# Altium project Sampler.PrjPCB (part 1 of 5)
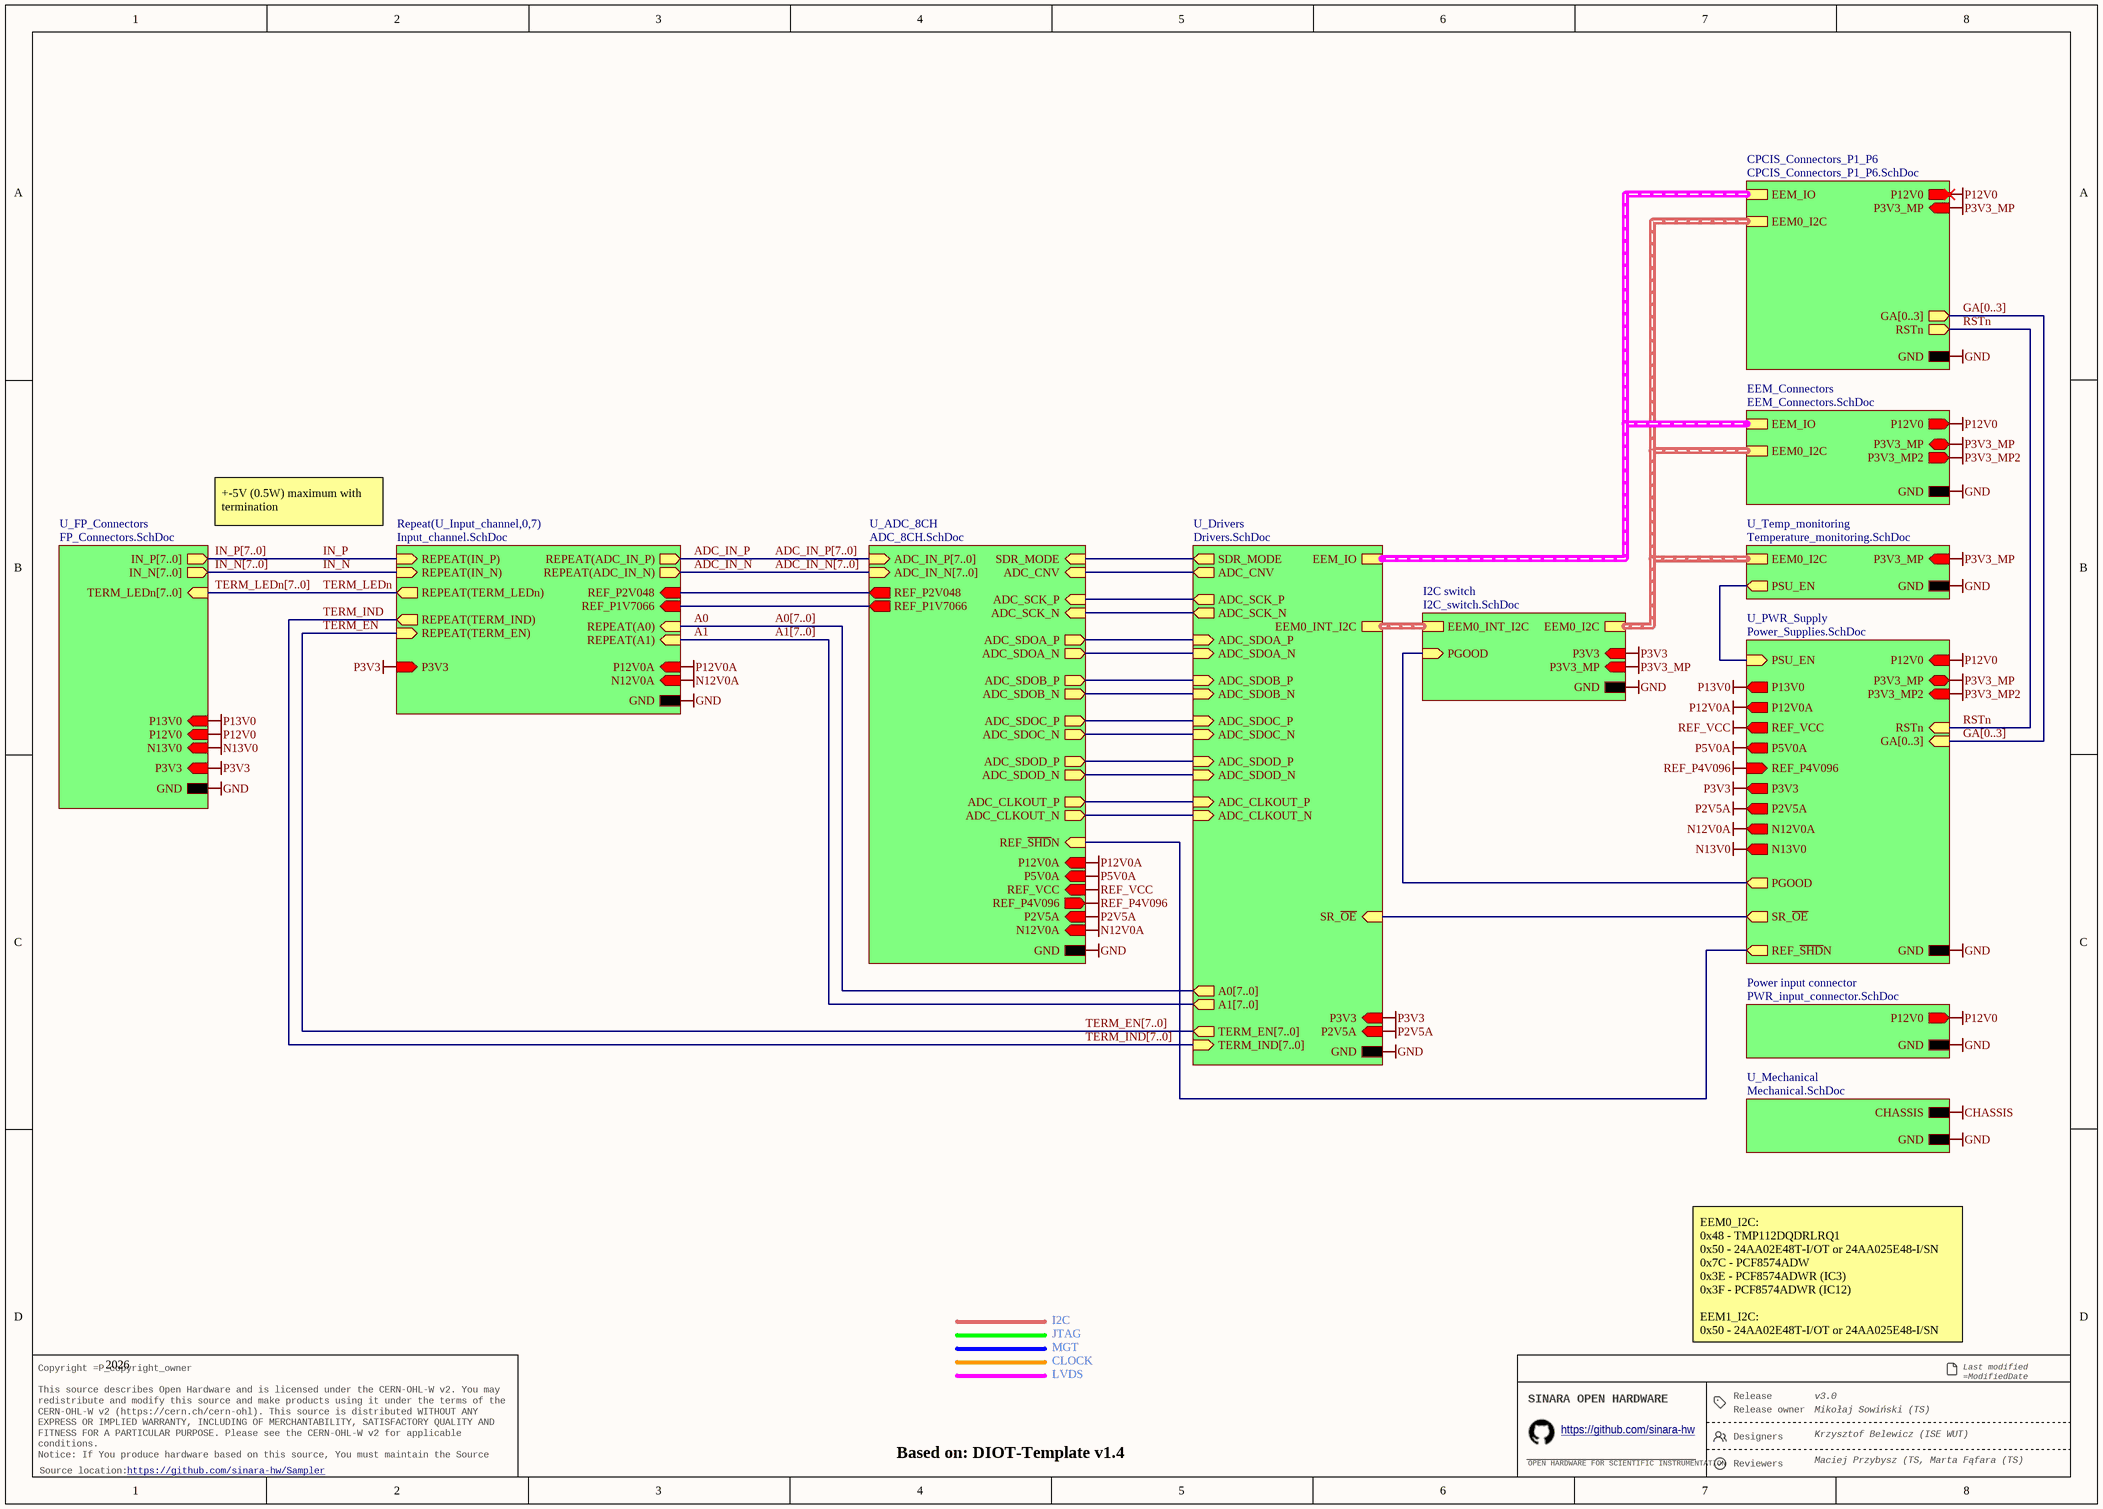
[diagram p0: Sampler.SchDoc]
P_version: 3.0; P_template_version: 1.4; P_release_reviewers: Maciej Przybysz (TS, Marta Fąfara (TS); P_release_owner: Mikołaj Sowiński (TS); P_release_designers: Krzysztof Belewicz (ISE WUT); P_github_link: https://github.com/sinara-hw/Sampler; P_copyright_owner: WUT ISE 2024-2025 · Technosystem 2025-2026
16 sheets, 774 parts. Net scope: strictly hierarchical (ports join the sheet entries above them; power ports are local).
Board file: Sampler.PCBDOC
Sheets:
  Sampler.SchDoc
    U_PWR_Supply = Power_Supplies.SchDoc
      U_Power-up_delay = Power-up_delay.SchDoc
      U_Power_main_DCDC = Power_main_DCDC.SchDoc
      LEDs = LEDs.SchDoc
    CPCIS_Connectors_P1_P6 = CPCIS_Connectors_P1_P6.SchDoc
      U_DIOT_signal_routing = DIOT_signal_routing.SchDoc
    EEM_Connectors = EEM_Connectors.SchDoc
    U_Temp_monitoring = Temperature_monitoring.SchDoc
    U_Mechanical = Mechanical.SchDoc
    U_FP_Connectors = FP_Connectors.SchDoc
    U_ADC_8CH = ADC_8CH.SchDoc
    U_Input_channel0 = Input_channel.SchDoc
    U_Input_channel1 = Input_channel.SchDoc
    U_Input_channel2 = Input_channel.SchDoc
    U_Input_channel3 = Input_channel.SchDoc
    U_Input_channel4 = Input_channel.SchDoc
    U_Input_channel5 = Input_channel.SchDoc
    U_Input_channel6 = Input_channel.SchDoc
    U_Input_channel7 = Input_channel.SchDoc
    U_Drivers = Drivers.SchDoc
    I2C switch = I2C_switch.SchDoc
    Power input connector = PWR_input_connector.SchDoc

## Sheet Sampler.SchDoc: =DocumentName
size A3; Version: 3.0; Github: https://github.com/sinara-hw/Sampler; Last modified by: Krzysztof Belewicz; DocumentNumber: 1; Revision: 0; SheetNumber: 1; SheetTotal: 1

### Sub-sheets
CPCIS_Connectors_P1_P6 = CPCIS_Connectors_P1_P6.SchDoc: P12V0 (out), P3V3_MP (in), EEM_IO (harness EEM_LVDS), EEM0_I2C (harness I2C), GA[0..3] (out), GND, RSTn (out)
EEM_Connectors = EEM_Connectors.SchDoc: P3V3_MP (bidir), P12V0 (out), EEM_IO (harness EEM_LVDS), EEM0_I2C (harness I2C), GND, P3V3_MP2 (out)
I2C switch = I2C_switch.SchDoc: PGOOD (in), EEM0_I2C (harness I2C), EEM0_INT_I2C (harness I2C), GND, P3V3 (in), P3V3_MP (in)
Power input connector = PWR_input_connector.SchDoc: P12V0 (out), GND
Repeat(U_Input_channel,0,7) = Input_channel.SchDoc: REPEAT(IN_N) (in), REPEAT(A0) (in), REPEAT(A1) (in), REPEAT(IN_P) (in), REPEAT(TERM_IND) (out), REPEAT(ADC_IN_N) (out), REPEAT(ADC_IN_P) (out), REF_P2V048 (in), REF_P1V7066 (in), GND, N12V0A (in), P12V0A (in), REPEAT(TERM_EN) (in), REPEAT(TERM_LEDn) (out), P3V3 (in)
U_ADC_8CH = ADC_8CH.SchDoc: ADC_IN_P[7..0] (in), ADC_IN_N[7..0] (in), ADC_SDOA_P (out), ADC_SDOA_N (out), ADC_SCK_P (in), ADC_SCK_N (in), ADC_CNV (in), ADC_SDOB_N (out), ADC_SDOB_P (out), ADC_SDOC_P (out), ADC_SDOC_N (out), ADC_SDOD_N (out), ADC_SDOD_P (out), ADC_CLKOUT_P (out), ADC_CLKOUT_N (out), SDR_MODE (in), REF_P2V048 (out), REF_P1V7066 (out), REF_~{SHD}N (in), GND, P2V5A (in), P5V0A (in), REF_VCC (in), P12V0A (in), N12V0A (in), REF_P4V096 (out)
U_Drivers = Drivers.SchDoc: EEM0_INT_I2C (harness I2C), EEM_IO (harness EEM_LVDS), SR_~{OE} (in), ADC_SCK_P (out), ADC_SDOA_N (in), ADC_CLKOUT_N (in), ADC_SCK_N (out), ADC_SDOA_P (in), ADC_SDOB_P (in), ADC_SDOD_N (in), ADC_CNV (out), ADC_SDOD_P (in), ADC_SDOC_P (in), ADC_SDOC_N (in), ADC_SDOB_N (in), ADC_CLKOUT_P (in), SDR_MODE (out), GND, P3V3 (in), P2V5A (in), A0[7..0] (out), TERM_IND[7..0] (in), A1[7..0] (out), TERM_EN[7..0] (out)
U_FP_Connectors = FP_Connectors.SchDoc: GND, P3V3 (in), IN_P[7..0] (out), IN_N[7..0] (out), TERM_LEDn[7..0] (in), N13V0 (in), P12V0 (in), P13V0 (in)
U_Mechanical = Mechanical.SchDoc: CHASSIS, GND
U_PWR_Supply = Power_Supplies.SchDoc: GND, P12V0 (in), P3V3_MP (bidir), PGOOD (out), GA[0..3] (in), RSTn (in), PSU_EN (in), P3V3_MP2 (in), SR_~{OE} (out), P13V0 (out), P12V0A (out), P5V0A (out), REF_VCC (out), REF_~{SHD}N (out), REF_P4V096 (in), P3V3 (out), P2V5A (out), N12V0A (out), N13V0 (out)
U_Temp_monitoring = Temperature_monitoring.SchDoc: GND, P3V3_MP (in), EEM0_I2C (harness I2C), PSU_EN (out)

### Nets
GND: sheet U_PWR_Supply/GND, sheet CPCIS_Connectors_P1_P6/GND, sheet EEM_Connectors/GND, sheet U_Temp_monitoring/GND, sheet U_Mechanical/GND, sheet U_FP_Connectors/GND, sheet U_ADC_8CH/GND, sheet Repeat(U_Input_channel,0,7)/GND, sheet U_Drivers/GND, sheet I2C switch/GND, sheet Power input connector/GND
N12V0A: sheet U_PWR_Supply/N12V0A, sheet U_ADC_8CH/N12V0A, sheet Repeat(U_Input_channel,0,7)/N12V0A
N13V0: sheet U_PWR_Supply/N13V0, sheet U_FP_Connectors/N13V0
P2V5A: sheet U_PWR_Supply/P2V5A, sheet U_ADC_8CH/P2V5A, sheet U_Drivers/P2V5A
P3V3: sheet U_PWR_Supply/P3V3, sheet U_FP_Connectors/P3V3, sheet Repeat(U_Input_channel,0,7)/P3V3, sheet U_Drivers/P3V3, sheet I2C switch/P3V3
P3V3_MP: sheet U_PWR_Supply/P3V3_MP, sheet CPCIS_Connectors_P1_P6/P3V3_MP, sheet EEM_Connectors/P3V3_MP, sheet U_Temp_monitoring/P3V3_MP, sheet I2C switch/P3V3_MP
P3V3_MP2: sheet U_PWR_Supply/P3V3_MP2, sheet EEM_Connectors/P3V3_MP2
P5V0A: sheet U_PWR_Supply/P5V0A, sheet U_ADC_8CH/P5V0A
P12V0: sheet U_PWR_Supply/P12V0, sheet CPCIS_Connectors_P1_P6/P12V0, sheet EEM_Connectors/P12V0, sheet U_FP_Connectors/P12V0, sheet Power input connector/P12V0
P12V0A: sheet U_PWR_Supply/P12V0A, sheet U_ADC_8CH/P12V0A, sheet Repeat(U_Input_channel,0,7)/P12V0A
P13V0: sheet U_PWR_Supply/P13V0, sheet U_FP_Connectors/P13V0
REF_P1V7066: sheet U_ADC_8CH/REF_P1V7066, sheet Repeat(U_Input_channel,0,7)/REF_P1V7066
REF_P2V048: sheet U_ADC_8CH/REF_P2V048, sheet Repeat(U_Input_channel,0,7)/REF_P2V048
REF_P4V096: sheet U_PWR_Supply/REF_P4V096, sheet U_ADC_8CH/REF_P4V096
REF_VCC: sheet U_PWR_Supply/REF_VCC, sheet U_ADC_8CH/REF_VCC
A0: sheet Repeat(U_Input_channel,0,7)/REPEAT(A0)
A1: sheet Repeat(U_Input_channel,0,7)/REPEAT(A1)
ADC_CLKOUT_N: sheet U_ADC_8CH/ADC_CLKOUT_N, sheet U_Drivers/ADC_CLKOUT_N
ADC_CLKOUT_P: sheet U_ADC_8CH/ADC_CLKOUT_P, sheet U_Drivers/ADC_CLKOUT_P
ADC_CNV: sheet U_ADC_8CH/ADC_CNV, sheet U_Drivers/ADC_CNV
ADC_IN_N: sheet Repeat(U_Input_channel,0,7)/REPEAT(ADC_IN_N)
ADC_IN_P: sheet Repeat(U_Input_channel,0,7)/REPEAT(ADC_IN_P)
ADC_SCK_N: sheet U_ADC_8CH/ADC_SCK_N, sheet U_Drivers/ADC_SCK_N
ADC_SCK_P: sheet U_ADC_8CH/ADC_SCK_P, sheet U_Drivers/ADC_SCK_P
ADC_SDOA_N: sheet U_ADC_8CH/ADC_SDOA_N, sheet U_Drivers/ADC_SDOA_N
ADC_SDOA_P: sheet U_ADC_8CH/ADC_SDOA_P, sheet U_Drivers/ADC_SDOA_P
ADC_SDOB_N: sheet U_ADC_8CH/ADC_SDOB_N, sheet U_Drivers/ADC_SDOB_N
ADC_SDOB_P: sheet U_ADC_8CH/ADC_SDOB_P, sheet U_Drivers/ADC_SDOB_P
ADC_SDOC_N: sheet U_ADC_8CH/ADC_SDOC_N, sheet U_Drivers/ADC_SDOC_N
ADC_SDOC_P: sheet U_ADC_8CH/ADC_SDOC_P, sheet U_Drivers/ADC_SDOC_P
ADC_SDOD_N: sheet U_ADC_8CH/ADC_SDOD_N, sheet U_Drivers/ADC_SDOD_N
ADC_SDOD_P: sheet U_ADC_8CH/ADC_SDOD_P, sheet U_Drivers/ADC_SDOD_P
IN_N: sheet Repeat(U_Input_channel,0,7)/REPEAT(IN_N)
IN_P: sheet Repeat(U_Input_channel,0,7)/REPEAT(IN_P)
PGOOD: sheet U_PWR_Supply/PGOOD, sheet I2C switch/PGOOD
PSU_EN: sheet U_PWR_Supply/PSU_EN, sheet U_Temp_monitoring/PSU_EN
REF_~{SHD}N: sheet U_PWR_Supply/REF_~{SHD}N, sheet U_ADC_8CH/REF_~{SHD}N
RSTn: sheet U_PWR_Supply/RSTn, sheet CPCIS_Connectors_P1_P6/RSTn
SDR_MODE: sheet U_ADC_8CH/SDR_MODE, sheet U_Drivers/SDR_MODE
SR_~{OE}: sheet U_PWR_Supply/SR_~{OE}, sheet U_Drivers/SR_~{OE}
TERM_EN: sheet Repeat(U_Input_channel,0,7)/REPEAT(TERM_EN)
TERM_IND: sheet Repeat(U_Input_channel,0,7)/REPEAT(TERM_IND)
TERM_LEDn: sheet Repeat(U_Input_channel,0,7)/REPEAT(TERM_LEDn)

### Buses and harness runs
bus A0[7..0] = sheet U_Drivers/A0[7..0]
bus A1[7..0] = sheet U_Drivers/A1[7..0]
bus ADC_IN_N[7..0] = sheet U_ADC_8CH/ADC_IN_N[7..0]
bus ADC_IN_P[7..0] = sheet U_ADC_8CH/ADC_IN_P[7..0]
bus GA[0..3] = sheet CPCIS_Connectors_P1_P6/GA[0..3] = sheet U_PWR_Supply/GA[0..3]
bus IN_N[7..0] = sheet U_FP_Connectors/IN_N[7..0]
bus IN_P[7..0] = sheet U_FP_Connectors/IN_P[7..0]
bus TERM_EN[7..0] = sheet U_Drivers/TERM_EN[7..0]
bus TERM_IND[7..0] = sheet U_Drivers/TERM_IND[7..0]
bus TERM_LEDn[7..0] = sheet U_FP_Connectors/TERM_LEDn[7..0]
harness sheet CPCIS_Connectors_P1_P6/EEM0_I2C = sheet EEM_Connectors/EEM0_I2C = sheet I2C switch/EEM0_I2C = sheet U_Temp_monitoring/EEM0_I2C
harness sheet CPCIS_Connectors_P1_P6/EEM_IO = sheet EEM_Connectors/EEM_IO = sheet U_Drivers/EEM_IO
harness sheet I2C switch/EEM0_INT_I2C = sheet U_Drivers/EEM0_INT_I2C

### Notes on the sheet
- +-5V (0.5W) maximum with termination
- I2C
- 2026
- JTAG
- MGT
- CLOCK
- LVDS
- EEM0_I2C:
  0x48 - TMP112DQDRLRQ1
  0x50 - 24AA02E48T-I/OT or 24AA025E48-I/SN
  0x7C - PCF8574ADW
  0x3E - PCF8574ADWR (IC3)
  0x3F - PCF8574ADWR (IC12)
  EEM1_I2C:
  0x50 - 24AA02E48T-I/OT or 24AA025E48-I/SN
- Release
- Last modified =ModifiedDate
  Sheet =sheetnumber of =sheettotal · Size A3
- Copyright =P_copyright_owner
  This source describes Open Hardware and is licensed under the CERN-OHL-W v2. You may redistribute and modify this source and make products using it under the terms of the CERN-OHL-W v2 (https://cern.ch/cern-ohl). This source is distributed WITHOUT ANY EXPRESS OR IMPLIED WARRANTY, INCLUDING OF MERCHANTABILITY, SATISFACTORY QUALITY AND FITNESS FOR A PARTICULAR PURPOSE. Please see the CERN-OHL-W v2 for applicable conditions.
  Notice: If You produce hardware based on this source, You must maintain the Source Location visible on the product, its packaging or its documentation.
- SINARA OPEN HARDWARE
- OPEN HARDWARE FOR SCIENTIFIC INSTRUMENTATION
- https://github.com/sinara-hw
- Release owner
- Designers
- Reviewers
- Source location:

## Sheet Power_Supplies.SchDoc: =DocumentName
size A4; SPICEModelCache: <root> / <DocumentId>GVTSYOHF</DocumentId> / </root>; Version: 3.0; Github: https://github.com/sinara-hw/Sampler; Last modified by: Krzysztof Belewicz; DocumentNumber: 1; Revision: 0; SheetNumber: 3; SheetTotal: 16
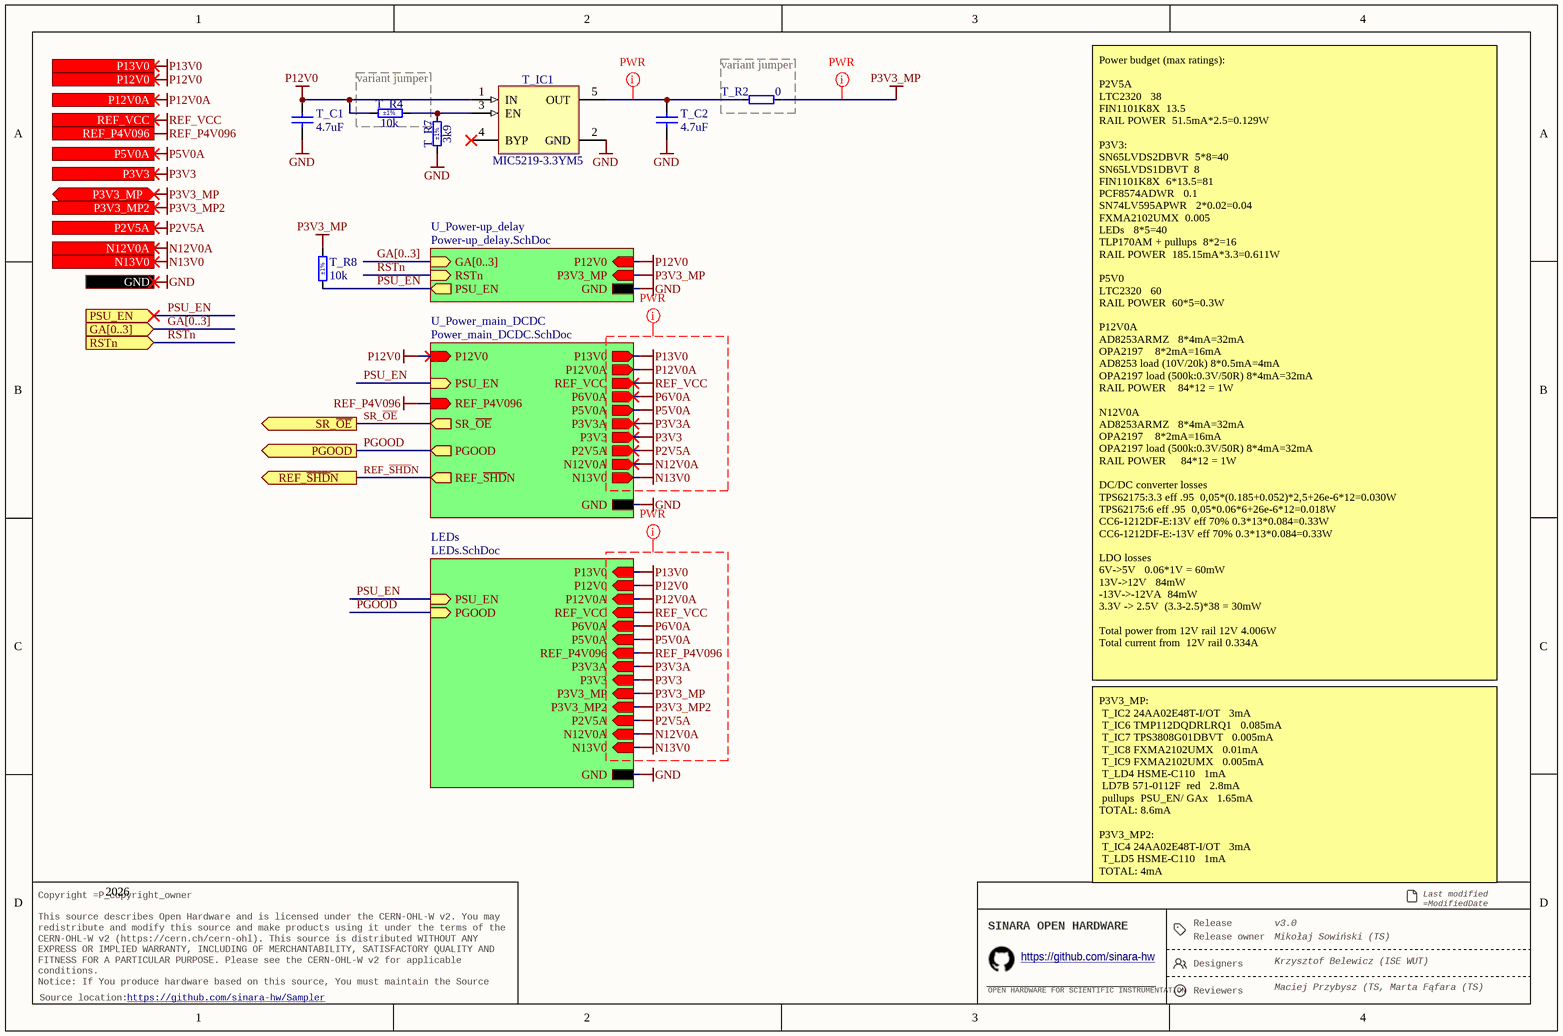
[diagram p1: Power_Supplies.SchDoc]

### Parts
T_C1  4.7uF  [CAPC2012X135N]
T_C2  4.7uF  [CAPC2012X135N]
T_IC1  MIC5219-3.3YM5  [SOT95P280X145-5N]
T_R2  0  [RESC1005X40N]
T_R4  10k  Tolerance: ±1%  [RESC1005X40N]
T_R7  3k9  Tolerance: ±1%  [RESC1005X40N]
T_R8  10k  Tolerance: ±1%  [RESC1005X40N]

### Blocks framed on the sheet
variant jumper: T_R4
variant jumper: T_R2

### Sub-sheets
LEDs = LEDs.SchDoc: PSU_EN (in), PGOOD (in), GND, P13V0 (in), P5V0A (in), P12V0A (in), P6V0A (in), REF_VCC (in), P3V3 (in), N13V0 (in), P2V5A (in), N12V0A (in), P3V3A (in), P12V0 (in), REF_P4V096 (in), P3V3_MP (in), P3V3_MP2 (in)
U_Power-up_delay = Power-up_delay.SchDoc: GA[0..3] (in), RSTn (in), GND, PSU_EN (out), P3V3_MP (in), P12V0 (in)
U_Power_main_DCDC = Power_main_DCDC.SchDoc: P12V0 (in), PSU_EN (in), P13V0 (out), P5V0A (out), P12V0A (out), SR_~{OE} (out), P6V0A (out), REF_VCC (out), PGOOD (out), REF_~{SHD}N (out), GND, P3V3 (out), N13V0 (out), P2V5A (out), N12V0A (out), P3V3A (out), REF_P4V096 (in)

### Ports
GA[0..3] (in), GND, N12V0A (out), N13V0 (out), P2V5A (out), P3V3 (out), P3V3_MP2 (in), P3V3_MP (bidir), P5V0A (out), P12V0 (in), P12V0A (out), P13V0 (out), PGOOD (out), PSU_EN (in), REF_P4V096 (in), REF_VCC (out), REF_~{SHD}N (out), RSTn (in), SR_~{OE} (out)

### Nets
GND: T_C1.1 T_C2.1 T_IC1.2(GND) T_R7.1 ; port GND, sheet U_Power-up_delay/GND, sheet U_Power_main_DCDC/GND, sheet LEDs/GND
N12V0A: port N12V0A, sheet U_Power_main_DCDC/N12V0A, sheet LEDs/N12V0A
N13V0: port N13V0, sheet U_Power_main_DCDC/N13V0, sheet LEDs/N13V0
P2V5A: port P2V5A, sheet U_Power_main_DCDC/P2V5A, sheet LEDs/P2V5A
P3V3: port P3V3, sheet U_Power_main_DCDC/P3V3, sheet LEDs/P3V3
P3V3_MP: T_R2.2 T_R8.2 ; port P3V3_MP, sheet U_Power-up_delay/P3V3_MP, sheet LEDs/P3V3_MP
P3V3_MP2: port P3V3_MP2, sheet LEDs/P3V3_MP2
P3V3A: sheet U_Power_main_DCDC/P3V3A, sheet LEDs/P3V3A
P5V0A: port P5V0A, sheet U_Power_main_DCDC/P5V0A, sheet LEDs/P5V0A
P6V0A: sheet U_Power_main_DCDC/P6V0A, sheet LEDs/P6V0A
P12V0: T_C1.2 T_IC1.1(IN) T_R4.1 ; port P12V0, sheet U_Power-up_delay/P12V0, sheet U_Power_main_DCDC/P12V0, sheet LEDs/P12V0
P12V0A: port P12V0A, sheet U_Power_main_DCDC/P12V0A, sheet LEDs/P12V0A
P13V0: port P13V0, sheet U_Power_main_DCDC/P13V0, sheet LEDs/P13V0
REF_P4V096: port REF_P4V096, sheet U_Power_main_DCDC/REF_P4V096, sheet LEDs/REF_P4V096
REF_VCC: port REF_VCC, sheet U_Power_main_DCDC/REF_VCC, sheet LEDs/REF_VCC
PGOOD: port PGOOD, sheet U_Power_main_DCDC/PGOOD, sheet LEDs/PGOOD
PSU_EN: T_R8.1 ; port PSU_EN, sheet U_Power-up_delay/PSU_EN, sheet U_Power_main_DCDC/PSU_EN, sheet LEDs/PSU_EN
REF_~{SHD}N: port REF_~{SHD}N, sheet U_Power_main_DCDC/REF_~{SHD}N
RSTn: port RSTn, sheet U_Power-up_delay/RSTn
SR_~{OE}: port SR_~{OE}, sheet U_Power_main_DCDC/SR_~{OE}
NetT_C2_2: T_C2.2 T_IC1.5(OUT) T_R2.1
NetT_IC1_3: T_IC1.3(EN) T_R4.2 T_R7.2

Not connected (* = marked no-connect by the designer): T_IC1 4(BYP)*

### Buses and harness runs
bus GA[0..3] = port GA[0..3]
bus GA[0..3] = sheet U_Power-up_delay/GA[0..3]

### Layout directives
net class PWR: N12V0A, N13V0, NetT_C2_2, P2V5A, P3V3, P3V3_MP, P3V3_MP2, P3V3A, P5V0A, P6V0A, P12V0, P12V0A, P13V0, REF_P4V096, REF_VCC

### Notes on the sheet
- Power budget (max ratings):
  P2V5A
  LTC2320			38
  FIN1101K8X		13.5
  RAIL POWER		51.5mA*2.5=0.129W
  P3V3:
  SN65LVDS2DBVR		5*8=40
  SN65LVDS1DBVT		8
  FIN1101K8X		6*13.5=81
  PCF8574ADWR 		0.1
  SN74LV595APWR 		2*0.02=0.04
  FXMA2102UMX		0.005
  LEDs			8*5=40
  TLP170AM + pullups		8*2=16
  RAIL POWER		185.15mA*3.3=0.611W
  P5V0
  LTC2320			60
  RAIL POWER		60*5=0.3W
  P12V0A
  AD8253ARMZ 		8*4mA=32mA
  OPA2197 			8*2mA=16mA
  AD8253 load (10V/20k)	8*0.5mA=4mA
  OPA2197 load (500k:0.3V/50R)	8*4mA=32mA
  RAIL POWER 		 84*12 = 1W
  N12V0A
  AD8253ARMZ 		8*4mA=32mA
  OPA2197 			8*2mA=16mA
  OPA2197 load (500k:0.3V/50R)	8*4mA=32mA
  RAIL POWER  		 84*12 = 1W
  DC/DC converter losses
  TPS62175:3.3 eff .95		0,05*(0.185+0.052)*2,5+26e-6*12=0.030W
  TPS62175:6 eff .95		0,05*0.06*6+26e-6*12=0.018W
  CC6-1212DF-E:13V eff 70%	0.3*13*0.084=0.33W
  CC6-1212DF-E:-13V eff 70%	0.3*13*0.084=0.33W
  LDO losses
  6V->5V			0.06*1V = 60mW
  13V->12V			84mW
  -13V->-12VA		84mW
  3.3V -> 2.5V		(3.3-2.5)*38 = 30mW
  Total power from 12V rail	12V 4.006W
  Total current from  12V rail	0.334A
- 2026
- P3V3_MP:
  T_IC2	24AA02E48T-I/OT			3mA
  T_IC6	TMP112DQDRLRQ1			0.085mA
  T_IC7	TPS3808G01DBVT			0.005mA
  T_IC8	FXMA2102UMX			0.01mA
  T_IC9	FXMA2102UMX			0.005mA
  T_LD4	HSME-C110			1mA
  LD7B	571-0112F	 red			2.8mA
  pullups 	PSU_EN/ GAx			1.65mA
  TOTAL: 8.6mA
  P3V3_MP2:
  T_IC4	24AA02E48T-I/OT			3mA
  T_LD5	HSME-C110			1mA
  TOTAL: 4mA
- Release
- Last modified =ModifiedDate
  Sheet =sheetnumber of =sheettotal · Size A4
- Copyright =P_copyright_owner
  This source describes Open Hardware and is licensed under the CERN-OHL-W v2. You may redistribute and modify this source and make products using it under the terms of the CERN-OHL-W v2 (https://cern.ch/cern-ohl). This source is distributed WITHOUT ANY EXPRESS OR IMPLIED WARRANTY, INCLUDING OF MERCHANTABILITY, SATISFACTORY QUALITY AND FITNESS FOR A PARTICULAR PURPOSE. Please see the CERN-OHL-W v2 for applicable conditions.
  Notice: If You produce hardware based on this source, You must maintain the Source Location visible on the product, its packaging or its documentation.
- SINARA OPEN HARDWARE
- OPEN HARDWARE FOR SCIENTIFIC INSTRUMENTATION
- https://github.com/sinara-hw
- Release owner
- Designers
- Reviewers
- Source location:

### Library data of the parts
T_C1 T_C2 = CC0805_4.7UF_16V_10%_X7R: Non-polarised capacitor; Part Description: SMD Multilayer Chip Ceramic Capacitor; Manufacturer: GENERIC; Manufacturer1 Part Number: EMK212B7475KG-T; Voltage: 16V; TC: X7R; Tolerance: ±10%; Part Number: CC0805_4.7UF_16V_10%_X7R; Component Kind: Standard; Component Type: Standard; Pin Count: 2; Value: 4.7uF; Status: Preferred; Manufacturer Part Number: CC0805_4.7UF_16V_10%_X7R; Case: 0805; Mounted: Yes; Socket: No; SMD: Yes; Sense: No; Manufacturer1 Example: TAIYO YUDEN; Manufacturer1 ComponentHeight: 1.35mm; HelpURL: \\cern.ch\dfs\Applications\Altium\Datasheets\CC0805_X7R_TAIYO-YUDEN_HIGH-VALUE.pdf; Author: CERN DEM JLC; CreateDate: 16.09.2014; LatestRevisionDate: 16.09.2014
T_IC1 = MIC5219-3.3YM5: 500mA Peak Output LDO Regulator; Part Description: 3.3V 500mA Peak Output Low Drop-Out  (LDO) Regulator; Manufacturer: MICROCHIP TECHNOLOGY; PressFit: No; Bonding: No; Part Number: MIC5219-3.3YM5; Component Kind: Standard; Component Type: Standard; Device: MIC5219-3.3YM5; PackageDescription: SOT, 0.95mm pitch; 5 pin, 1.60mm W X 2.90mm L X 1.45mm H body, IPC Medium Density; Manufacturer Part Number: MIC5219-3.3YM5; Pin Count: 5; Case: SOT23-5; Mounted: Yes; Socket: No; SMD: Yes; Sense: No; ComponentHeight: 1.45mm; HelpURL: \\cern.ch\dfs\Applications\Altium\Datasheets\MIC5219-3.3YM5.pdf; Author: CERN DEM WB; CreateDate: 2019-04-16; LatestRevisionDate: 2019-04-16
T_R2 = R0402_0R_JUMPER: Resistor; Part Description: 1A (0.05R Max DC Resistance) Zero Ohm Jumper; Manufacturer: GENERIC; Manufacturer1 Part Number: 232270591001L; PressFit: No; Part Number: R0402_0R_JUMPER; Component Kind: Standard; Component Type: Standard; Pin Count: 2; Value: 0; Status: Not Recommended; Manufacturer Part Number: R0402_0R_JUMPER; Case: 0402; Mounted: Yes; Sense: No; Socket: No; SMD: Yes; Manufacturer1 Example: YAGEO PHYCOMP; Manufacturer1 ComponentHeight: 0.4mm; HelpURL: \\cern.ch\dfs\Applications\Altium\Datasheets\R0402_Phycomp_RC0402.pdf; Author: CERN DEM JLC; CreateDate: 03.12.2007; LatestRevisionDate: 17.10.2012
T_R4 T_R8 = R0402_10K_1%_0.0625W_100PPM: Resistor - 1%; Part Description: General Purpose Thick Film Chip Resistor; Manufacturer: GENERIC; Manufacturer1 Part Number: 232270671003L; TC: ±100ppm/°C; PressFit: No; Part Number: R0402_10K_1%_0.0625W_100PPM; Component Kind: Standard; Component Type: Standard; Pin Count: 2; Value: 10k; Status: Not Recommended; Power: 0.0625W; Manufacturer Part Number: R0402_10K_1%_0.0625W_100PPM; Case: 0402; Mounted: Yes; Sense: No; Socket: No; SMD: Yes; Manufacturer1 Example: YAGEO PHYCOMP; Manufacturer1 ComponentHeight: 0.4mm; HelpURL: \\cern.ch\dfs\Applications\Altium\Datasheets\R0402_Phycomp_RC0402.pdf; Author: CERN DEM JLC; CreateDate: 03.12.2007; LatestRevisionDate: 17.10.2012
T_R7 = R0402_3K9_1%_0.0625W_100PPM: Resistor - 1%; Part Description: General Purpose Thick Film Chip Resistor; Manufacturer: GENERIC; Manufacturer1 Part Number: 232270673902L; TC: ±100ppm/°C; PressFit: No; Part Number: R0402_3K9_1%_0.0625W_100PPM; Component Kind: Standard; Component Type: Standard; Pin Count: 2; Value: 3k9; Status: Not Recommended; Power: 0.0625W; Manufacturer Part Number: R0402_3K9_1%_0.0625W_100PPM; Case: 0402; Mounted: Yes; Sense: No; Socket: No; SMD: Yes; Manufacturer1 Example: YAGEO PHYCOMP; Manufacturer1 ComponentHeight: 0.4mm; HelpURL: \\cern.ch\dfs\Applications\Altium\Datasheets\R0402_Phycomp_RC0402.pdf; Author: CERN DEM JLC; CreateDate: 03.12.2007; LatestRevisionDate: 17.10.2012

## Sheet Power-up_delay.SchDoc: =DocumentName
size A4; Version: 3.0; Github: https://github.com/sinara-hw/Sampler; Last modified by: Krzysztof Belewicz; DocumentNumber: 1; Revision: 0; SheetNumber: 4; SheetTotal: 16
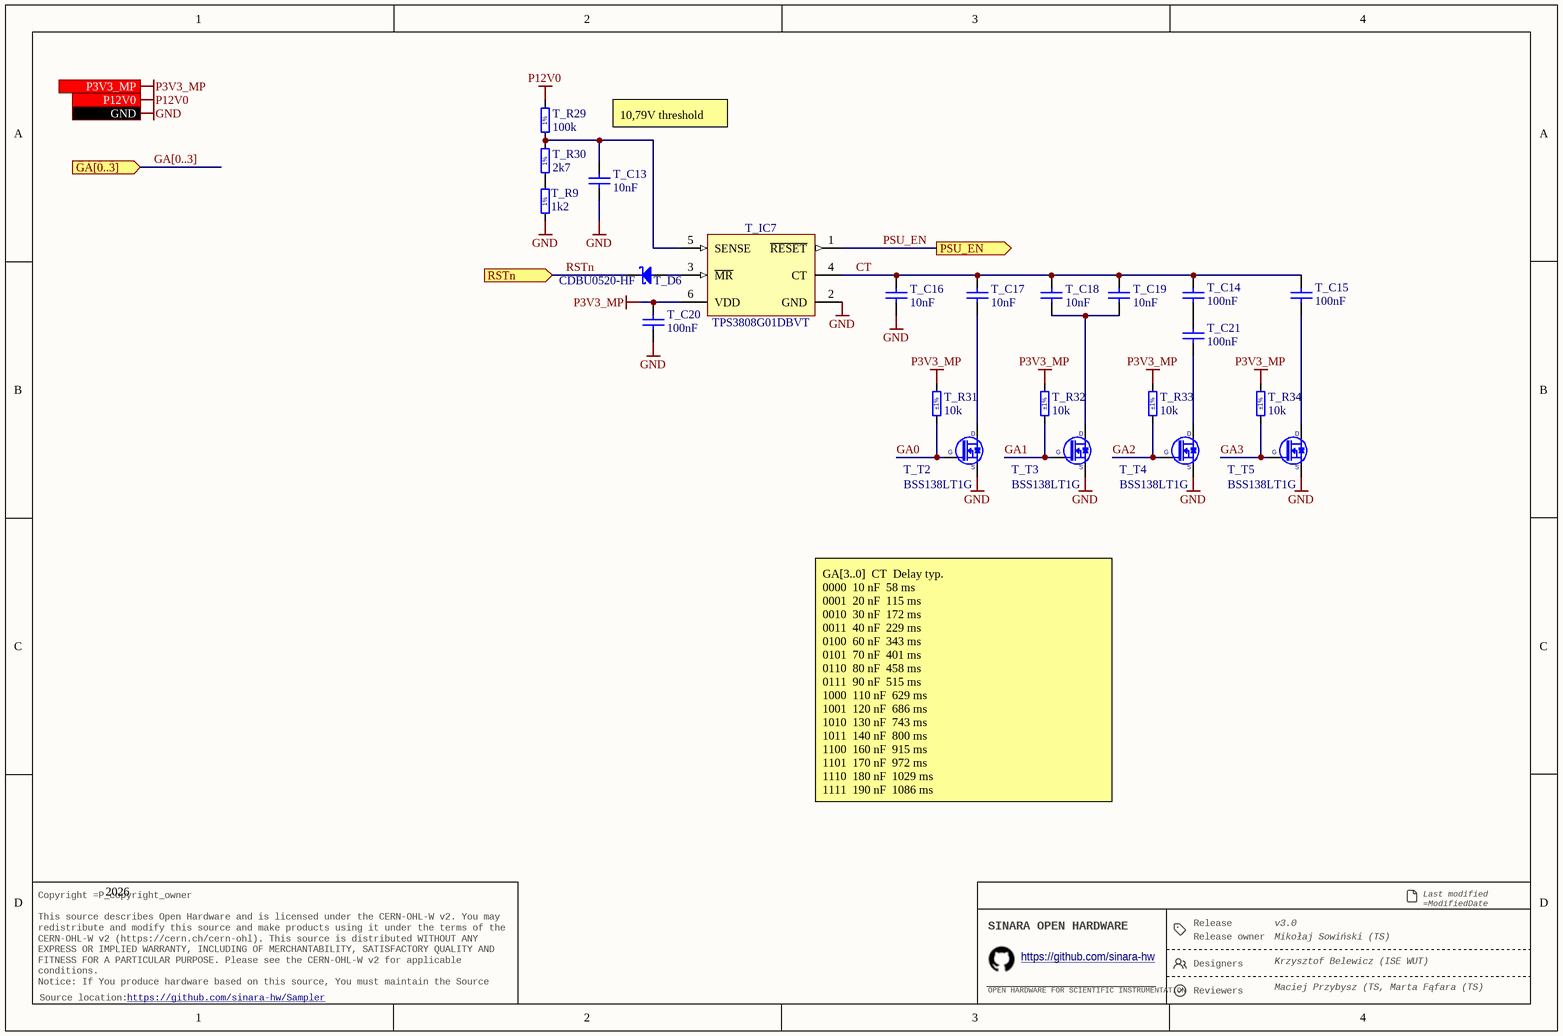
[diagram p2: Power-up_delay.SchDoc]

### Parts
T_C13  10nF  [CAPC1005X55N]
T_C14  100nF  [CAPC1005X55N]
T_C15  100nF  [CAPC1005X55N]
T_C16  10nF  [CAPC1005X55N]
T_C17  10nF  [CAPC1005X55N]
T_C18  10nF  [CAPC1005X55N]
T_C19  10nF  [CAPC1005X55N]
T_C20  100nF  [CAPC1005X55N]
T_C21  100nF  [CAPC1005X55N]
T_D6  CDBU0520-HF  [SOD-523F]
T_IC7  TPS3808G01DBVT  [SOT95P280X145-6N]
T_R9  1k2  [RESC1608X55N]
T_R29  100k  [RESC1608X55N]
T_R30  2k7  [RESC1608X55N]
T_R31  10k  Tolerance: ±1%  [RESC1005X40N]
T_R32  10k  Tolerance: ±1%  [RESC1005X40N]
T_R33  10k  Tolerance: ±1%  [RESC1005X40N]
T_R34  10k  Tolerance: ±1%  [RESC1005X40N]
T_T2  BSS138LT1G  [SOT95P240X110-3N]
T_T3  BSS138LT1G  [SOT95P240X110-3N]
T_T4  BSS138LT1G  [SOT95P240X110-3N]
T_T5  BSS138LT1G  [SOT95P240X110-3N]

### Ports
GA[0..3] (in), GND, P3V3_MP (in), P12V0 (in), PSU_EN (out), RSTn (in)

### Nets
GND: T_C13.2 T_C16.1 T_C20.1 T_IC7.2(GND) T_R9.1 T_T2.2(S) T_T3.2(S) T_T4.2(S) T_T5.2(S) ; port GND
P3V3_MP: T_C20.2 T_IC7.6(VDD) T_R31.2 T_R32.2 T_R33.2 T_R34.2 ; port P3V3_MP
P12V0: T_R29.2 ; port P12V0
CT: T_C14.2 T_C15.2 T_C16.2 T_C17.2 T_C18.2 T_C19.2 T_IC7.4(CT)
GA0: T_R31.1 T_T2.1(G)
GA1: T_R32.1 T_T3.1(G)
GA2: T_R33.1 T_T4.1(G)
GA3: T_R34.1 T_T5.1(G)
PSU_EN: T_IC7.1(~{RESET}) ; port PSU_EN
RSTn: T_D6.1(C) ; port RSTn
NetT_C13_1: T_C13.1 T_IC7.5(SENSE) T_R29.1 T_R30.2
NetT_C14_1: T_C14.1 T_C21.2
NetT_C15_1: T_C15.1 T_T5.3(D)
NetT_C17_1: T_C17.1 T_T2.3(D)
NetT_C18_1: T_C18.1 T_C19.1 T_T3.3(D)
NetT_C21_1: T_C21.1 T_T4.3(D)
NetT_D6_2: T_D6.2(A) T_IC7.3(~{MR})
NetT_R9_2: T_R9.2 T_R30.1

### Buses and harness runs
bus GA[0..3] = port GA[0..3]

### Notes on the sheet
- 10,79V threshold
- GA[3..0]		CT		Delay typ.
  0000		10 nF		58 ms
  0001		20 nF		115 ms
  0010		30 nF		172 ms
  0011		40 nF		229 ms
  0100		60 nF		343 ms
  0101		70 nF		401 ms
  0110		80 nF		458 ms
  0111		90 nF		515 ms
  1000		110 nF		629 ms
  1001		120 nF		686 ms
  1010		130 nF		743 ms
  1011		140 nF		800 ms
  1100		160 nF		915 ms
  1101		170 nF		972 ms
  1110		180 nF		1029 ms
  1111		190 nF		1086 ms
- 2026
- Release
- Last modified =ModifiedDate
  Sheet =sheetnumber of =sheettotal · Size A4
- Copyright =P_copyright_owner
  This source describes Open Hardware and is licensed under the CERN-OHL-W v2. You may redistribute and modify this source and make products using it under the terms of the CERN-OHL-W v2 (https://cern.ch/cern-ohl). This source is distributed WITHOUT ANY EXPRESS OR IMPLIED WARRANTY, INCLUDING OF MERCHANTABILITY, SATISFACTORY QUALITY AND FITNESS FOR A PARTICULAR PURPOSE. Please see the CERN-OHL-W v2 for applicable conditions.
  Notice: If You produce hardware based on this source, You must maintain the Source Location visible on the product, its packaging or its documentation.
- SINARA OPEN HARDWARE
- OPEN HARDWARE FOR SCIENTIFIC INSTRUMENTATION
- https://github.com/sinara-hw
- Release owner
- Designers
- Reviewers
- Source location:
- (in symbol R0603_1K2_1%_0.1W_100PPM) 1%
- (in symbol R0603_2K7_1%_0.1W_100PPM) 1%
- (in symbol R0603_100K_1%_0.1W_100PPM) 1%

### Library data of the parts
T_C13 T_C16-T_C19 = CC0402_10NF_50V_5%_X7R: Non-polarised capacitor; Part Description: SMD Multilayer Chip Ceramic Capacitor; Manufacturer: GENERIC; Manufacturer1 Part Number: C0402C103J5RAC; Voltage: 50V; TC: X7R; Tolerance: ±5%; Part Number: CC0402_10NF_50V_5%_X7R; Component Kind: Standard; Component Type: Standard; Pin Count: 2; Value: 10nF; Status: Preferred; Manufacturer Part Number: CC0402_10NF_50V_5%_X7R; Case: 0402; Mounted: Yes; Socket: No; SMD: Yes; Sense: No; Manufacturer1 Example: KEMET; Manufacturer1 ComponentHeight: 0.55mm; HelpURL: \\cern.ch\dfs\Applications\Altium\Datasheets\CC0402_X7R_KEMET.pdf; Author: CERN DEM BC; CreateDate: 15.07.2020; LatestRevisionDate: 15.07.2020
T_C14 T_C15 T_C20 T_C21 = CC0402_100NF_50V_10%_X7R: Non-polarised capacitor; Part Description: SMD Multilayer Chip Ceramic Capacitor; Manufacturer: GENERIC; Manufacturer1 Part Number: GRM155R71H104KE14D; Voltage: 50V; TC: X7R; Tolerance: ±10%; Part Number: CC0402_100NF_50V_10%_X7R; Component Kind: Standard; Component Type: Standard; Pin Count: 2; Value: 100nF; Status: None; Manufacturer Part Number: CC0402_100NF_50V_10%_X7R; Case: 0402; Mounted: Yes; Socket: No; SMD: Yes; Sense: No; Manufacturer1 Example: MURATA; Manufacturer1 ComponentHeight: 0.55mm; HelpURL: \\cern.ch\dfs\Applications\Altium\Datasheets\CC0402_MURATA_GRM155R71H104KE14D.pdf; Author: CERN DEM MR; CreateDate: 30.06.2017; LatestRevisionDate: 30.06.2017
T_D6 = CDBU0520-HF: Schottky Diode; Part Description: 20V Surface mount Schottky Barrier Diode; Manufacturer: COMCHIP; Voltage: 20V; Power: 500mA; PressFit: No; Bonding: No; Part Number: CDBU0520-HF; Component Kind: Standard; Component Type: Standard; Device: CDBU0520-HF; PackageDescription: Small Outline Diode Flat Lead (SOD-523F), Body; 1.80mm L X 1mm W X 0.85mm H; Manufacturer Part Number: CDBU0520-HF; Pin Count: 2; Case: SOD-523F; Mounted: Yes; Socket: No; SMD: Yes; Sense: No; ComponentHeight: 1mm; HelpURL: \\cern.ch\dfs\Applications\Altium\Datasheets\CDBU0520-HF.pdf; Author: CERN DEM HF; CreateDate: 13.10.2023; LatestRevisionDate: 13.10.2023
T_IC7 = TPS3808G01DBVT: Low Quiescent Current, Programmable-Delay Supervisory Circuit; Part Description: Adjustable Low Quiescent Current, Programmable-Delay Supervisory Circuit; Manufacturer: TEXAS INSTRUMENTS; PressFit: No; Bonding: No; Part Number: TPS3808G01DBVT; Component Kind: Standard; Component Type: Standard; Device: TPS3808G01DBVT; PackageDescription: SOT, 0.95mm Pitch; 6 Pin, 1.60mm W X 2.90mm L X 1.45mm H body, IPC Medium Density; Manufacturer Part Number: TPS3808G01DBV; Pin Count: 6; Case: SOT23-6; Mounted: Yes; Socket: No; SMD: Yes; Sense: No; ComponentHeight: 1.45mm; Author: CERN DEM JLC; HelpURL: \\cern.ch\dfs\Applications\Altium\Datasheets\TPS3808G01DBVT.pdf; CreateDate: 22.10.2008; LatestRevisionDate: 10.06.2022
T_R9 = R0603_1K2_1%_0.1W_100PPM: Resistor - 1%; Part Description: General Purpose Thick Film Chip Resistor; Manufacturer: GENERIC; Manufacturer1 Part Number: NRC06F1201TRF; Power: 0.1W; TC: ±100ppm/°C; Part Number: R0603_1K2_1%_0.1W_100PPM; Component Kind: Standard; Component Type: Standard; Pin Count: 2; Value: 1k2; Status: Preferred; Tolerance: ±1%; Manufacturer Part Number: R0603_1K2_1%_0.1W_100PPM; Case: 0603; Mounted: Yes; Sense: No; Socket: No; SMD: Yes; Manufacturer1 Example: NIC COMPONENT; Manufacturer1 ComponentHeight: 0.55mm; HelpURL: \\cern.ch\dfs\Applications\Altium\Datasheets\R0603_NIC_NRC.pdf; Author: CERN DEM JLC; CreateDate: 03.12.2007; LatestRevisionDate: 13.03.2008
T_R29 = R0603_100K_1%_0.1W_100PPM: Resistor - 1%; Part Description: General Purpose Thick Film Chip Resistor; Manufacturer: GENERIC; Manufacturer1 Part Number: NRC06F1003TRF; Power: 0.1W; TC: ±100ppm/°C; Part Number: R0603_100K_1%_0.1W_100PPM; Component Kind: Standard; Component Type: Standard; Pin Count: 2; Value: 100k; Status: Preferred; Tolerance: ±1%; Manufacturer Part Number: R0603_100K_1%_0.1W_100PPM; Case: 0603; Mounted: Yes; Sense: No; Socket: No; SMD: Yes; Manufacturer1 Example: NIC COMPONENT; Manufacturer1 ComponentHeight: 0.55mm; HelpURL: \\cern.ch\dfs\Applications\Altium\Datasheets\R0603_NIC_NRC.pdf; Author: CERN DEM JLC; CreateDate: 03.12.2007; LatestRevisionDate: 13.03.2008
T_R30 = R0603_2K7_1%_0.1W_100PPM: Resistor - 1%; Part Description: General Purpose Thick Film Chip Resistor; Manufacturer: GENERIC; Manufacturer1 Part Number: RC0603FR-072K7L; Power: 0.1W; TC: ±100ppm/°C; Part Number: R0603_2K7_1%_0.1W_100PPM; Component Kind: Standard; Component Type: Standard; Pin Count: 2; Value: 2k7; Status: Preferred; Tolerance: ±1%; Manufacturer Part Number: R0603_2K7_1%_0.1W_100PPM; Case: 0603; Mounted: Yes; Sense: No; Socket: No; SMD: Yes; Manufacturer1 Example: YAGEO PHYCOMP; Manufacturer1 ComponentHeight: 0.55mm; HelpURL: \\cern.ch\dfs\Applications\Altium\Datasheets\R0603_PHYCOMP_RC0603.pdf; Author: CERN DEM JLC; CreateDate: 02.05.2011; LatestRevisionDate: 02.05.2011
T_R31-T_R34 = R0402_10K_1%_0.0625W_100PPM: as T_R4 on sheet Power_Supplies; Part Number: R0402_10K_1%_0.0625W_100PPM; Component Kind: Standard; Component Type: Standard; Pin Count: 2; Value: 10k; Status: Not Recommended; Power: 0.0625W; Manufacturer Part Number: R0402_10K_1%_0.0625W_100PPM; Case: 0402; Mounted: Yes; Sense: No; Socket: No; SMD: Yes; Manufacturer1 Example: YAGEO PHYCOMP; Manufacturer1 ComponentHeight: 0.4mm; HelpURL: \\cern.ch\dfs\Applications\Altium\Datasheets\R0402_Phycomp_RC0402.pdf; Author: CERN DEM JLC; CreateDate: 03.12.2007; LatestRevisionDate: 17.10.2012
T_T2-T_T5 = BSS138LT1G: N-CHANNEL MOSFET WITH DIODE; Part Description: 50V, 200mA N-Channel Enhancement Mode Field-Effect Transistor; Manufacturer: ON SEMICONDUCTOR; PressFit: No; Bonding: No; Part Number: BSS138LT1G; Component Kind: Standard; Component Type: Standard; Device: BSS138LT1G; PackageDescription: SOT23, 0.95mm Pitch; 3 Pin, 1.40mm W X 3.00mm L X 1.10mm H body, IPC Medium Density; Manufacturer Part Number: BSS138L; Pin Count: 3; Case: SOT23-3; Mounted: Yes; Socket: No; SMD: Yes; Sense: No; ComponentHeight: 1.11mm; HelpURL: \\cern.ch\dfs\Applications\Altium\Datasheets\BSS138LT1G.pdf; Author: CERN DEM JLC; CreateDate: 23.03.2009; LatestRevisionDate: 25.05.2022